# Altium schematic sheet Output_Distribute.SchDoc
size A4; SheetNumber: 4; SheetTotal: 4
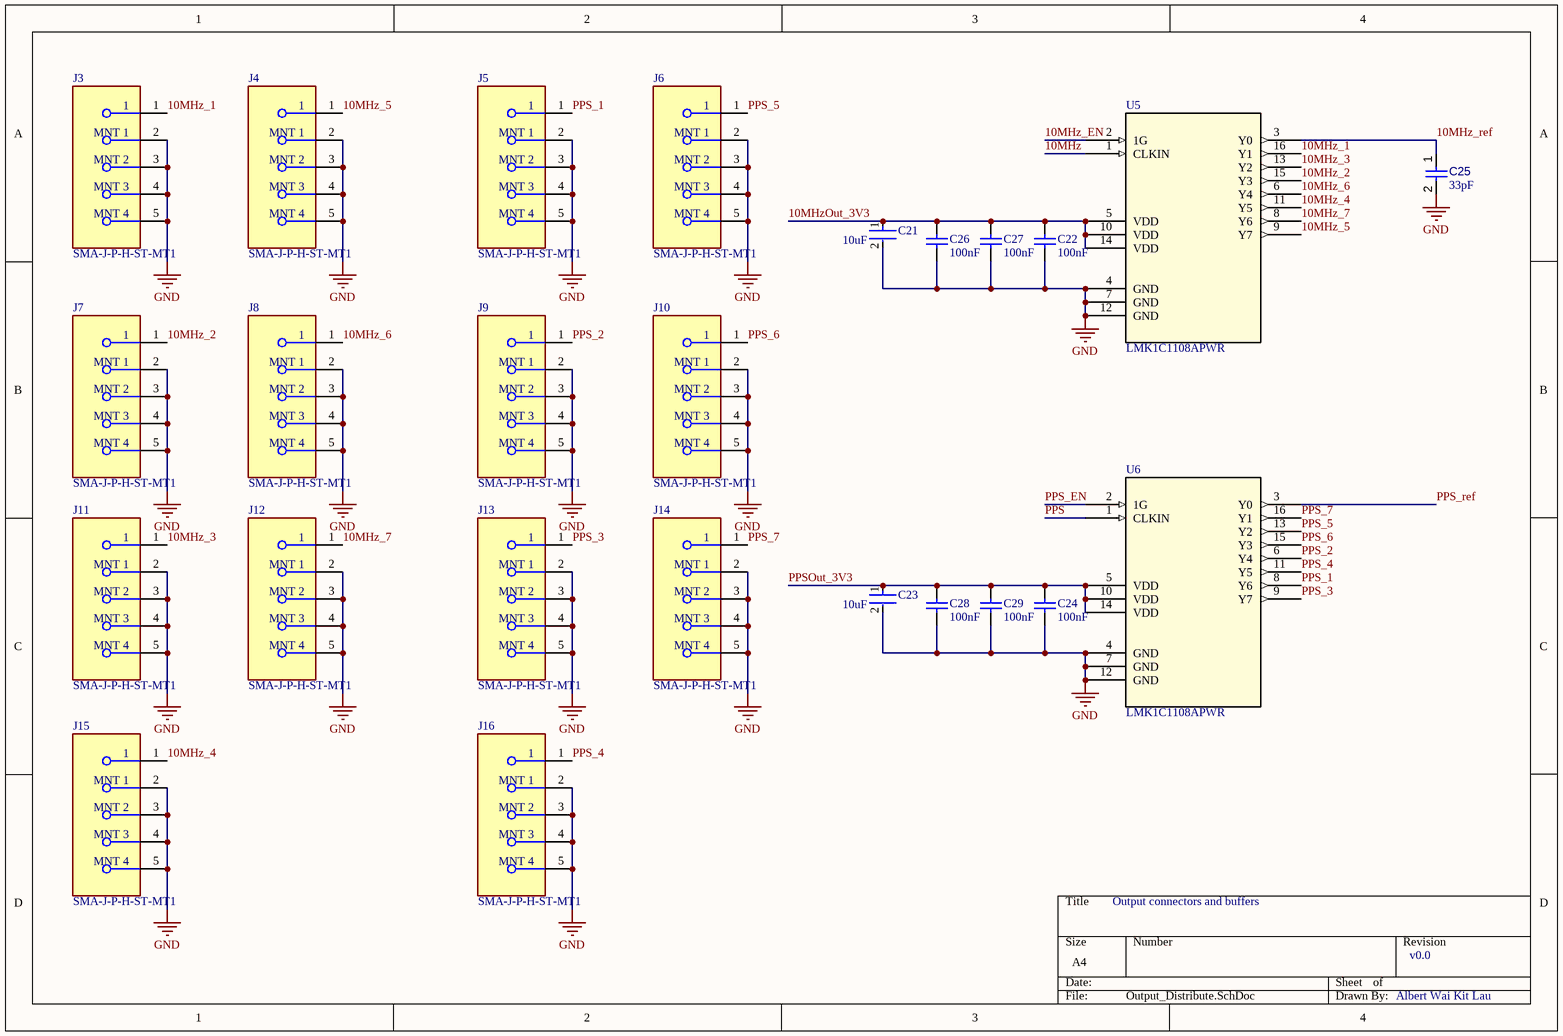
[diagram p0: Output_Distribute.SchDoc]

## Parts
C21  10uF  [FP-GRM21B-0_2-e0_2_0_7-IPC_A]
C22  100nF  [CAPC1050X55X23ML05T13]
C23  10uF  [FP-GRM21B-0_2-e0_2_0_7-IPC_A]
C24  100nF  [CAPC1050X55X23ML05T13]
C25  value 33pF  [CAPC1005X56X25ML10T15]  (hidden comment: Capacitor 0.5 pF +/- 0.1pF 25 V 0402)
C26  100nF  [CAPC1050X55X23ML05T13]
C27  100nF  [CAPC1050X55X23ML05T13]
C28  100nF  [CAPC1050X55X23ML05T13]
C29  100nF  [CAPC1050X55X23ML05T13]
J3  SMA-J-P-H-ST-MT1  [FP-SMA-J-P-H-ST-MT1-MFG]
J4  SMA-J-P-H-ST-MT1  [FP-SMA-J-P-H-ST-MT1-MFG]
J5  SMA-J-P-H-ST-MT1  [FP-SMA-J-P-H-ST-MT1-MFG]
J6  SMA-J-P-H-ST-MT1  [FP-SMA-J-P-H-ST-MT1-MFG]
J7  SMA-J-P-H-ST-MT1  [FP-SMA-J-P-H-ST-MT1-MFG]
J8  SMA-J-P-H-ST-MT1  [FP-SMA-J-P-H-ST-MT1-MFG]
J9  SMA-J-P-H-ST-MT1  [FP-SMA-J-P-H-ST-MT1-MFG]
J10  SMA-J-P-H-ST-MT1  [FP-SMA-J-P-H-ST-MT1-MFG]
J11  SMA-J-P-H-ST-MT1  [FP-SMA-J-P-H-ST-MT1-MFG]
J12  SMA-J-P-H-ST-MT1  [FP-SMA-J-P-H-ST-MT1-MFG]
J13  SMA-J-P-H-ST-MT1  [FP-SMA-J-P-H-ST-MT1-MFG]
J14  SMA-J-P-H-ST-MT1  [FP-SMA-J-P-H-ST-MT1-MFG]
J15  SMA-J-P-H-ST-MT1  [FP-SMA-J-P-H-ST-MT1-MFG]
J16  SMA-J-P-H-ST-MT1  [FP-SMA-J-P-H-ST-MT1-MFG]
U5  LMK1C1108APWR  [TSSOP16_4P5X5P1_TEX]
U6  LMK1C1108APWR  [TSSOP16_4P5X5P1_TEX]

## Nets
GND: C21.2 C22.2 C23.2 C24.2 C25.2 C26.2 C27.2 C28.2 C29.2 J3.2(MNT_1) J3.3(MNT_2) J3.4(MNT_3) J3.5(MNT_4) J4.2(MNT_1) J4.3(MNT_2) J4.4(MNT_3) J4.5(MNT_4) J5.2(MNT_1) J5.3(MNT_2) J5.4(MNT_3) J5.5(MNT_4) J6.2(MNT_1) J6.3(MNT_2) J6.4(MNT_3) J6.5(MNT_4) J7.2(MNT_1) J7.3(MNT_2) J7.4(MNT_3) J7.5(MNT_4) J8.2(MNT_1) J8.3(MNT_2) J8.4(MNT_3) J8.5(MNT_4) J9.2(MNT_1) J9.3(MNT_2) J9.4(MNT_3) J9.5(MNT_4) J10.2(MNT_1) J10.3(MNT_2) J10.4(MNT_3) J10.5(MNT_4) J11.2(MNT_1) J11.3(MNT_2) J11.4(MNT_3) J11.5(MNT_4) J12.2(MNT_1) J12.3(MNT_2) J12.4(MNT_3) J12.5(MNT_4) J13.2(MNT_1) J13.3(MNT_2) J13.4(MNT_3) J13.5(MNT_4) J14.2(MNT_1) J14.3(MNT_2) J14.4(MNT_3) J14.5(MNT_4) J15.2(MNT_1) J15.3(MNT_2) J15.4(MNT_3) J15.5(MNT_4) J16.2(MNT_1) J16.3(MNT_2) J16.4(MNT_3) J16.5(MNT_4) U5.4(GND) U5.7(GND) U5.12(GND) U6.4(GND) U6.7(GND) U6.12(GND)
10MHz: U5.1(CLKIN)
10MHz_1: J3.1 U5.16(Y1)
10MHz_2: J7.1 U5.15(Y3)
10MHz_3: J11.1 U5.13(Y2)
10MHz_4: J15.1 U5.11(Y5)
10MHz_5: J4.1 U5.9(Y7)
10MHz_6: J8.1 U5.6(Y4)
10MHz_7: J12.1 U5.8(Y6)
10MHz_EN: U5.2(1G)
10MHz_ref: C25.1 U5.3(Y0)
10MHzOut_3V3: C21.1 C22.1 C26.1 C27.1 U5.5(VDD) U5.10(VDD) U5.14(VDD)
PPS: U6.1(CLKIN)
PPS_1: J5.1 U6.8(Y6)
PPS_2: J9.1 U6.6(Y4)
PPS_3: J13.1 U6.9(Y7)
PPS_4: J16.1 U6.11(Y5)
PPS_5: J6.1 U6.13(Y2)
PPS_6: J10.1 U6.15(Y3)
PPS_7: J14.1 U6.16(Y1)
PPS_EN: U6.2(1G)
PPS_ref: U6.3(Y0)
PPSOut_3V3: C23.1 C24.1 C28.1 C29.1 U6.5(VDD) U6.10(VDD) U6.14(VDD)

## Notes on the sheet
- Output connectors and buffers
- v0.0
- Albert Wai Kit Lau

## Library data of the parts
C21 C23 = CMP-06035-004402-1: Chip Multilayer Ceramic Capacitors for General Purpose, 0805, 10uF, X5R, 15%, 10%, 50V; Voltage Rating (DC): 50V; Dielectric: X5R; Tolerance: 10%; Capacitance: 10uF; Thickness: 1.25mm; Length: 2mm; Width: 1.25mm; JLCPCB: C440198
C22 C24 C26-C29 = CMP-2000-05439-1: Chip Capacitor, 100 nF, +/- 10%, 16 V, -55 to 125 degC, 0402 (1005 Metric), RoHS, Tape and Reel; Manufacturer: Samsung Electro-Mechanics; Capacitance: 100000pF; Dielectric: X7R; Rated Voltage: 16V; Case Size/Dimension: 0402; Tolerance (%): ±10%; Manufacturer URL: http://www.samsungsem.com/global/index.jsp; Datasheet URL: https://datasheet.ciiva.com/29198/458718-da-01-en-vs-kondensator-0402-29198423.pdf; Datasheet Version: Nov-10; JLCPCB: C1525
C25 = CMP-001-00002-6: Voltage Rating: 25V; Tolerance: 20%; Capacitor Type: Ceramic; Max Operating Temperature: 125°C; Case/Package: 0402; Pins: 2; RoHS Compliant: True; Min Operating Temperature: -55°C; Mounting Technology: SM; JLCPCB: C76905
J3-J16 = CMP-002-00073-1: RF Connectors / Coaxial Connectors 6 GHz, 50 Ohm SMA Jack or Plug, Cable Connector; Case/Package: SMA; Mounting Technology: Through Hole
U5 U6 = LMK1C1108APWR: 1.8V,2.5V or 3.3V asynchronous 8 channel output LVCMOS buffer 16-TSSOP -40 to 125; Manufacturer_Name: Texas Instruments; Copyright: Copyright (C) 2026 Ultra Librarian. All rights reserved.; Manufacturer_Part_Number: LMK1C1108APWR; RefDes: RefDes; Type: Type